# EasyEDA Pro project eda_uahyxtbgs-165w-three-way-multi-protocol-fa-dc91a91e.epro, board PCB_嘉立创8838*130mm铝机壳PCB尺寸13*8.4cm
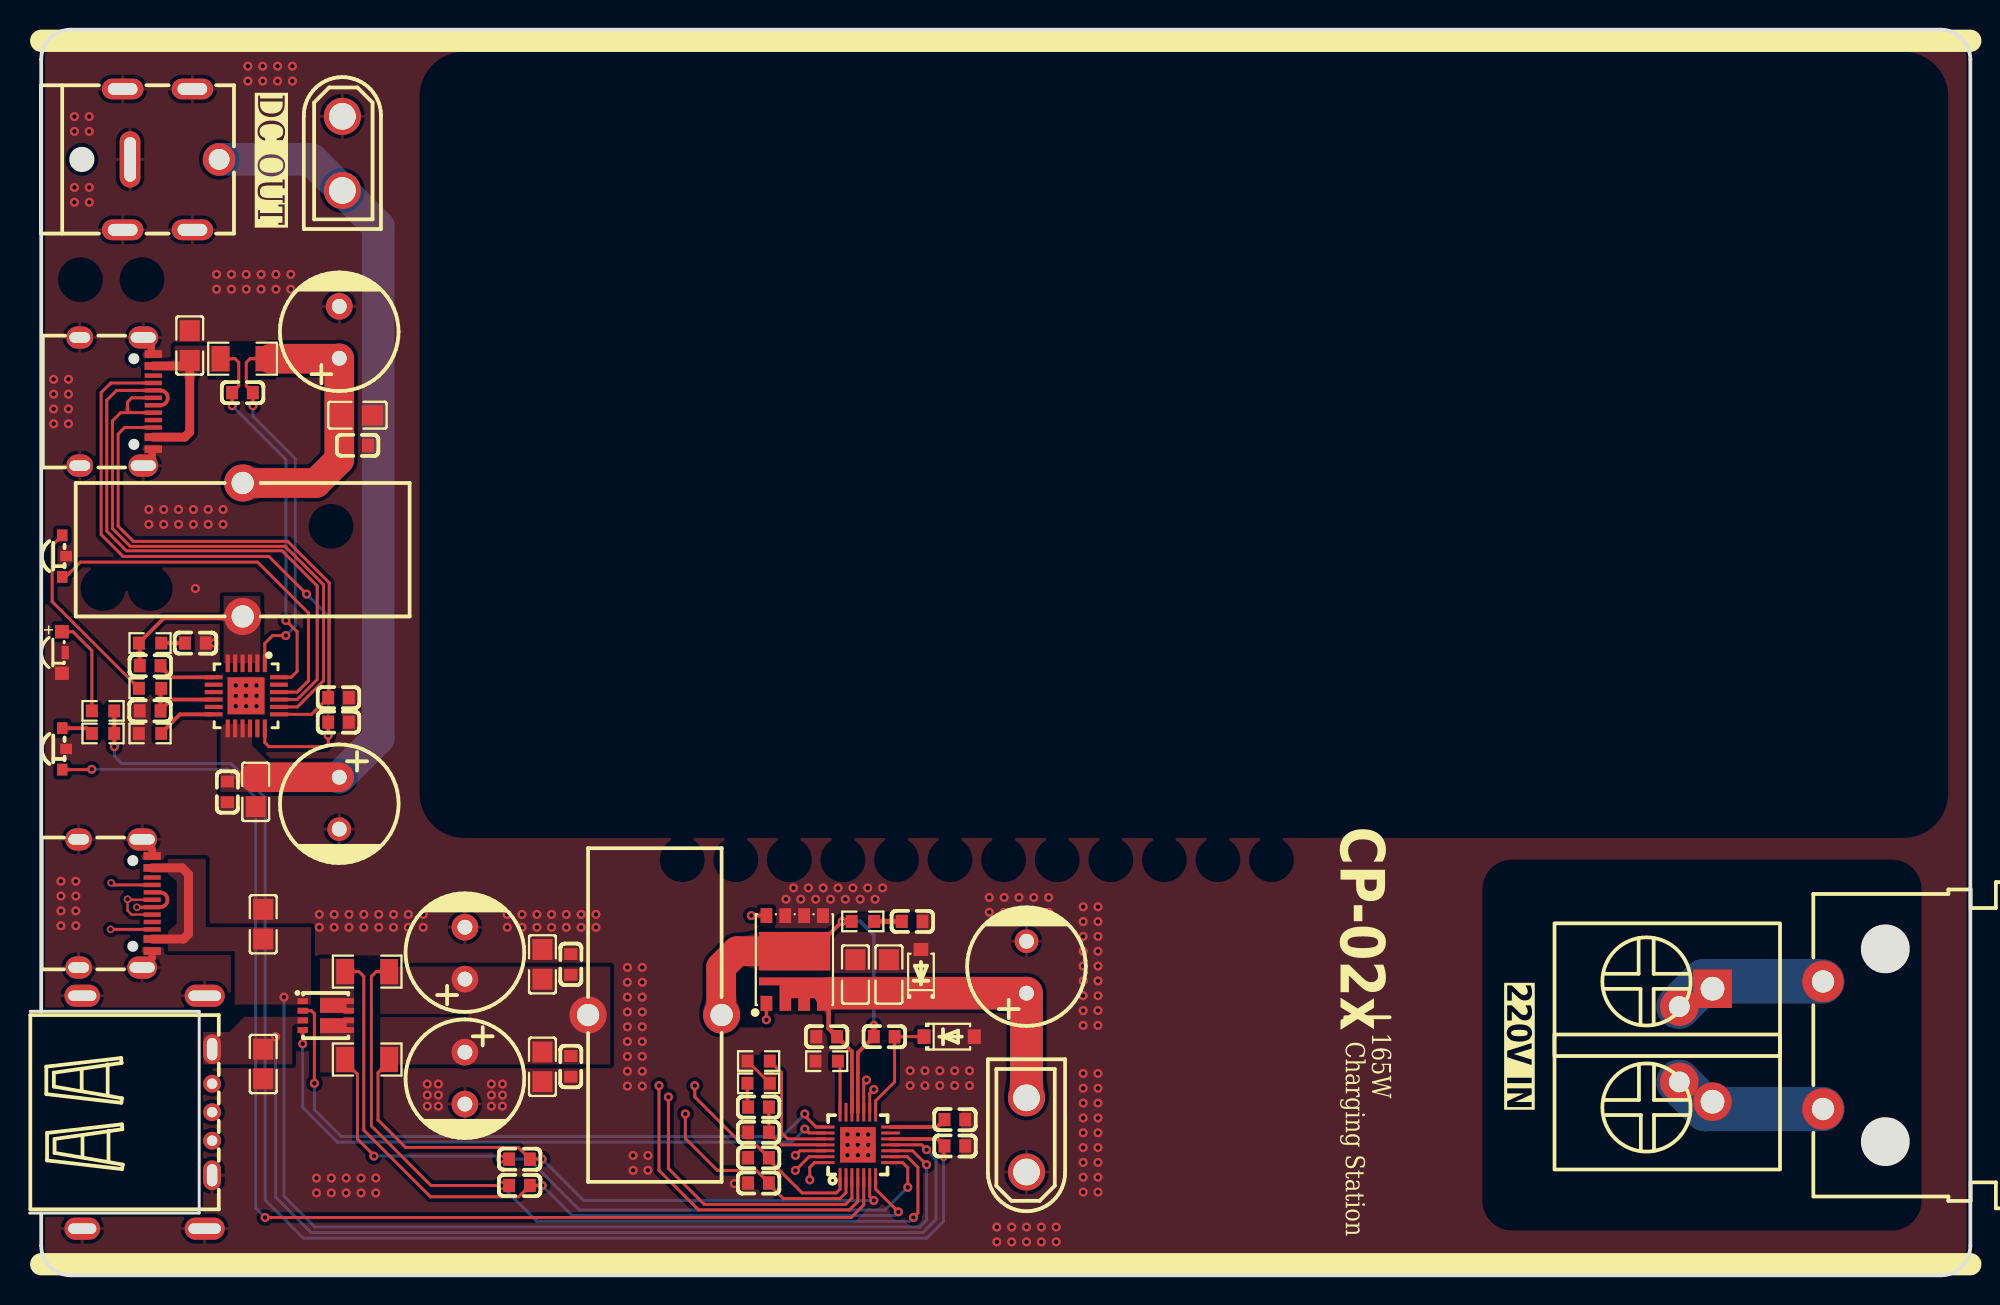
[diagram p8: board, top side]
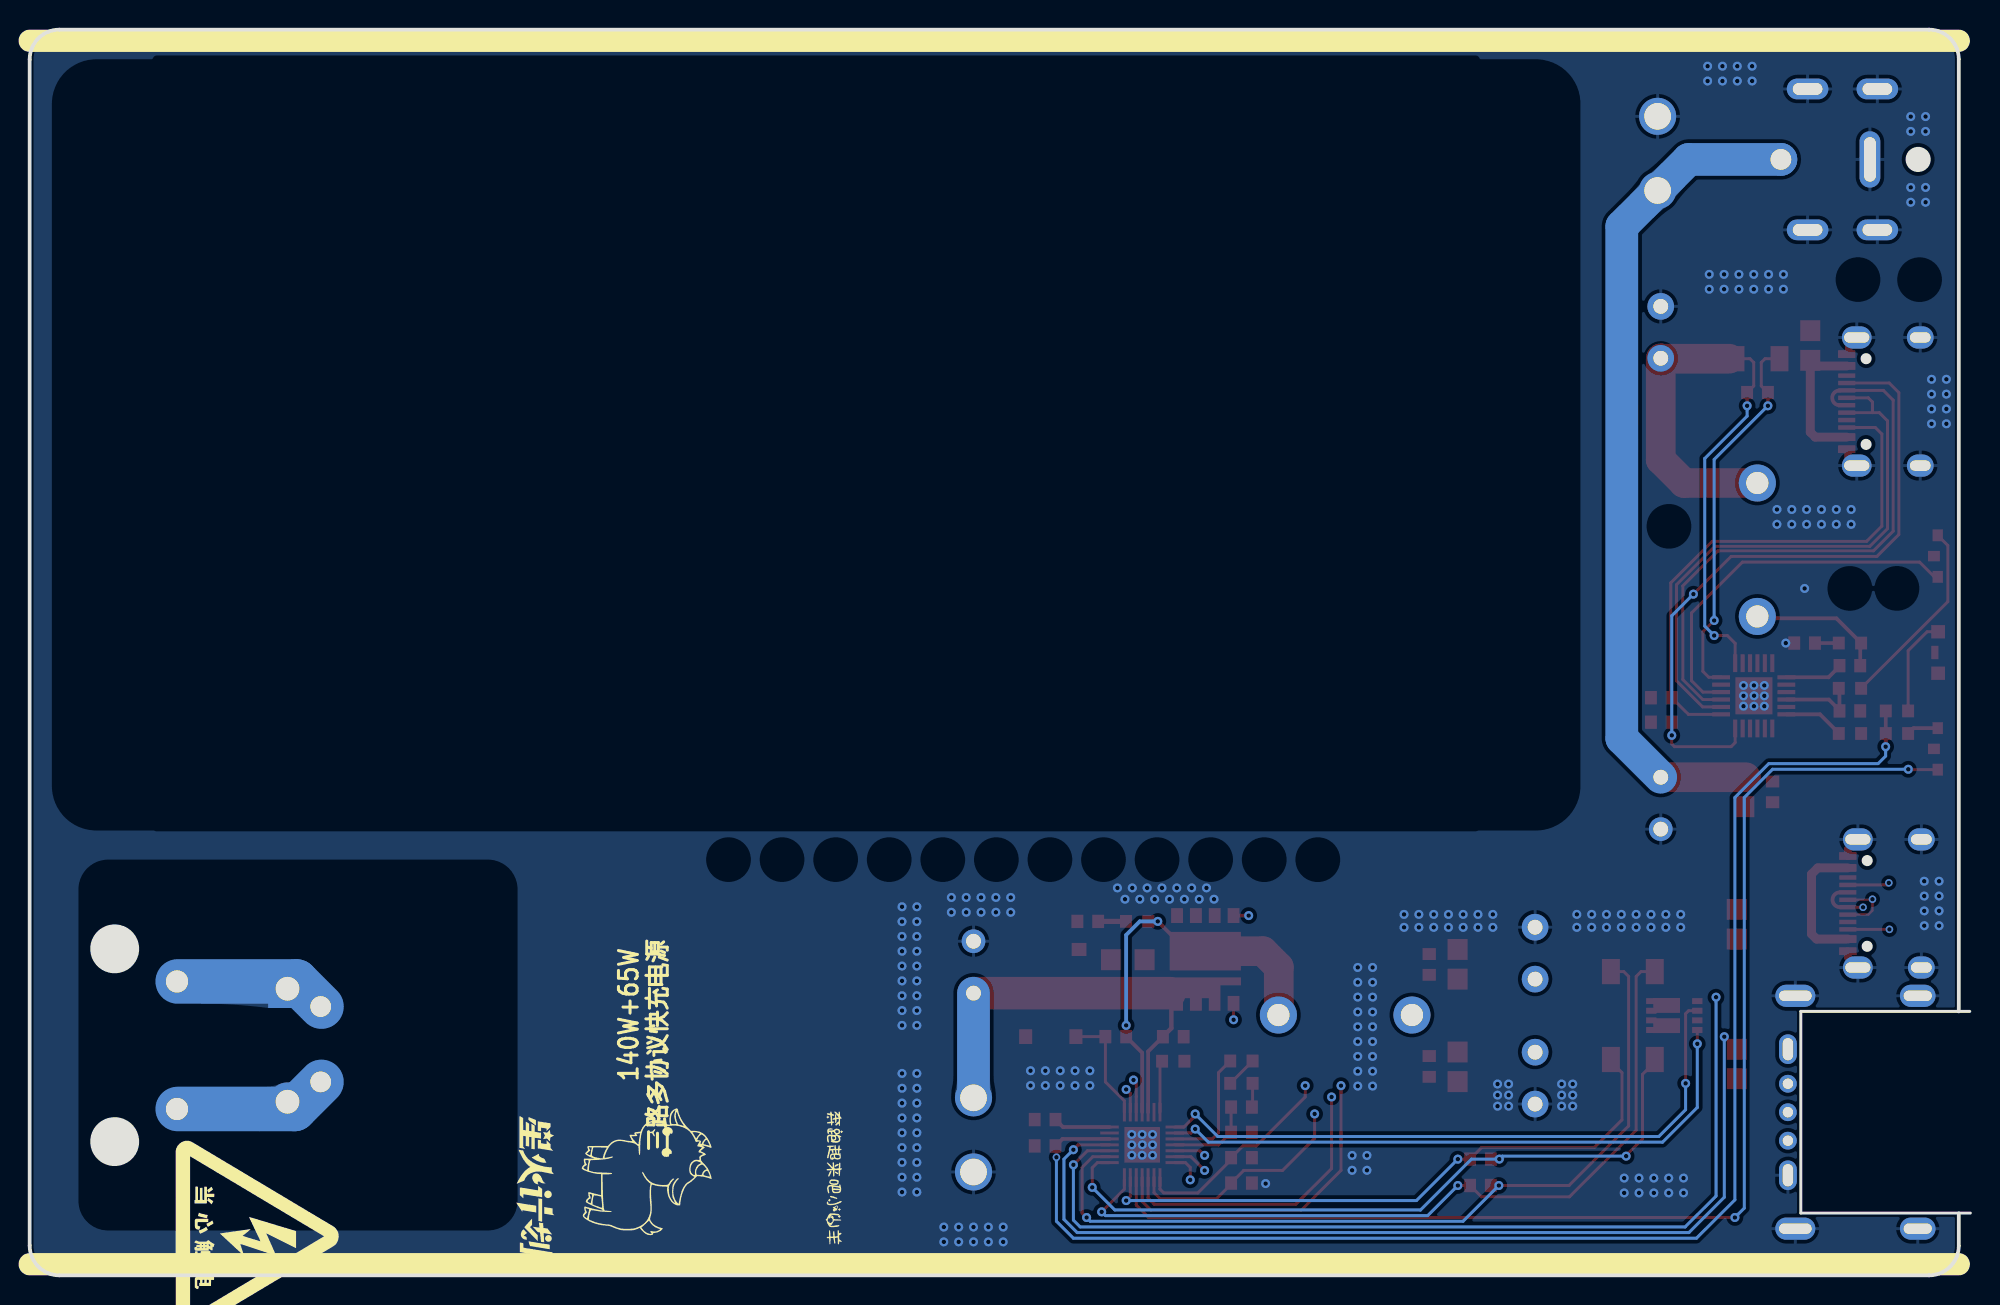
[diagram p9: board, bottom side, seen from below]

Outline 130.78 x 84 mm; copper layers: Top Layer, Inner1, Inner2, Bottom Layer. Coordinates in mm from the lower left corner of the outline.
Outline path: 0.78,17.8 0.78,82 arc(1.36,83.41) 2.78,84 128.78,84 arc(130.19,83.41) 130.78,82 130.78,2 arc(130.19,0.59) 128.78,0 2.78,0 arc(1.36,0.59) 0.78,2 0.78,4.18
Stack: Top Layer 0.035mm 外层铜厚1oz / Dielectric1 0.2104mm 7628 RC49% 8.6mil / Inner1 0.0152mm 内层铜厚 / Dielectric2 1.065mm 1.1mm H/HOZ Copper / Inner2 0.0152mm 内层铜厚 / Dielectric3 0.2104mm 7628 RC49% 8.6mil / Bottom Layer 0.035mm 外层铜厚1oz

## Design rules (mm)
spacing copperThickness1oz: track to track 0.102, other pairs 0.152 to 0.3
spacing copperThickness2oz (default): track to track 0.102, other pairs 0.152 to 0.3
spacing Plane_innerPlane: track to track 0.102, other pairs 0.152 to 0.3
spacing Copper_copperRegion: track to track 0.102, other pairs 0.152 to 0.3
track width copperThickness1oz (default): min 0.127, default 0.254, max 6
track width copperThickness2oz: min 0.203, default 0.254, max 2.54
differential pair differentialPair (default): width min 0.127, default 0.254, max 2.54; gap min 0.152, default 0.152
region e1 uses Copper_copperRegion
region e2 uses Copper_copperRegion
region e3 uses Copper_copperRegion
region e4 uses Copper_copperRegion
region e5 uses Copper_copperRegion
region e6 uses Copper_copperRegion
region e7 uses Copper_copperRegion
region e8 uses Copper_copperRegion
region e9 uses Copper_copperRegion
region e10 uses Copper_copperRegion
region e11 uses Copper_copperRegion
region e12 uses Copper_copperRegion
region e13 uses Copper_copperRegion
region e14 uses Copper_copperRegion
region e15 uses Copper_copperRegion
region e16 uses Copper_copperRegion
region e17 uses Copper_copperRegion
region e18 uses Copper_copperRegion
region e19 uses Copper_copperRegion
region e20 uses Copper_copperRegion
region e21 uses Copper_copperRegion
region e22 uses Copper_copperRegion
region e23 uses Copper_copperRegion
region e24 uses Copper_copperRegion
region e25 uses Copper_copperRegion
region e26 uses Copper_copperRegion
region e27 uses Copper_copperRegion
region e28 uses Copper_copperRegion
region e29 uses Copper_copperRegion
region e30 uses Copper_copperRegion
region e31 uses Copper_copperRegion
region e32 uses Copper_copperRegion
region e33 uses Copper_copperRegion
region e34 uses Copper_copperRegion
region e35 uses Copper_copperRegion
region e36 uses Copper_copperRegion
region e37 uses Copper_copperRegion
region e38 uses Copper_copperRegion
region e39 uses Copper_copperRegion
region e40 uses Copper_copperRegion
region e41 uses Copper_copperRegion
region e42 uses Copper_copperRegion
region e43 uses Copper_copperRegion
region e44 uses Copper_copperRegion
region e45 uses Copper_copperRegion
region e46 uses Copper_copperRegion
region e47 uses Copper_copperRegion
region e48 uses Copper_copperRegion
region e49 uses Copper_copperRegion
region e50 uses Copper_copperRegion
region e51 uses Copper_copperRegion
region e52 uses Copper_copperRegion
region e53 uses Copper_copperRegion
region e54 uses Copper_copperRegion
region e55 uses Copper_copperRegion
region e56 uses Copper_copperRegion
region e57 uses Copper_copperRegion
region e58 uses Copper_copperRegion
region e59 uses Copper_copperRegion
region e60 uses Copper_copperRegion
region e61 uses Copper_copperRegion
region e62 uses Copper_copperRegion
region e63 uses Copper_copperRegion
region e64 uses Copper_copperRegion
region e65 uses Copper_copperRegion
region e66 uses Copper_copperRegion
region e67 uses Copper_copperRegion
region e68 uses Copper_copperRegion
region e69 uses Copper_copperRegion
region e70 uses Copper_copperRegion
region e71 uses Copper_copperRegion
region e72 uses Copper_copperRegion
region e73 uses Copper_copperRegion
region e74 uses Copper_copperRegion
region e75 uses Copper_copperRegion
region e76 uses Copper_copperRegion
region e77 uses Copper_copperRegion
region e78 uses Copper_copperRegion
region e79 uses Copper_copperRegion
region e80 uses Copper_copperRegion
region e81 uses Copper_copperRegion
region e82 uses Copper_copperRegion
region e83 uses Copper_copperRegion
region e84 uses Copper_copperRegion
region e85 uses Copper_copperRegion
region e86 uses Copper_copperRegion
region e87 uses Copper_copperRegion
region e88 uses Copper_copperRegion
region e89 uses Copper_copperRegion
region e90 uses Copper_copperRegion
region e91 uses Copper_copperRegion
region e92 uses Copper_copperRegion
region e93 uses Copper_copperRegion
pour e841 uses Copper_copperRegion
pour e930 uses Copper_copperRegion
pour e1018 uses Copper_copperRegion

## Placement (name value [footprint] x y rotation side)
C1  100pF  [C0603]  49.11 9.64 180 top
C2  2.2nF  [C0603_1]  49.11 11.35 180 top
C3  100nF  [C0603_1]  53.71 16.09 0 top
C4  22uF  [C0805]  57.9 20.28 270 top
C5  330pF  [C0603]  49.11 7.93 180 top
C6  22uF  [C0805]  15.23 32.6 90 top
C7  330pF  [C0603]  49.11 6.23 180 top
C8  100nF  [C0603_1]  57.59 16.1 180 top
C9  100nF  [C0603_1]  36.46 20.97 270 top
C10  22uF  [C0805]  34.55 20.97 270 top
C11  10uF  [C0805]  15.74 14.25 90 top
C12  1uF  [C0603]  62.35 8.73 180 top
C13  1uF  [C0603]  62.35 10.5 180 top
C14  10uF  [C0805]  15.74 23.68 270 top
C15  100nF  [C0603_1]  33.01 7.84 180 top
C16  100nF  [C0603_1]  33.01 6.06 180 top
C17  330pF  [C0603]  20.82 38.95 0 top
C18  330pF  [C0603]  20.82 37.3 0 top
C19  100nF  [C0603_1]  13.33 32.6 90 top
C20  100nF  [C0603_1]  8.12 41.11 180 top
C21  1uF  [C0603]  8.12 38.06 0 top
C22  2.2nF  [C0603_1]  11.17 42.64 180 top
C23  100nF  [C0603_1]  22.09 55.97 180 top
C24  22uF  [C0805]  22.09 58 180 top
C25  100nF  [C0603_1]  14.34 59.53 180 top
C26  10uF  [C0805]  10.79 62.7 270 top
C32  2.2nF  [C0603_1]  59.47 23.87 180 top
C33  22uF  [C0805]  34.55 14.06 90 top
C34  100nF  [C0603_1]  36.46 14.09 90 top
C35  22uF  [C0805]  55.65 20.28 270 top
CN2  RT-C08-F2-BH  [AC-IN-TH_RT-C08-F2-WH]  120.85 15.52 90 top
CN3  XT30UPB-M  [CONN-TH_XT30UPB-M]  21.07 75.66 270 top
EC1  220uF  [CAP-TH_BD8.0-P3.50-D0.6-FD-2]  67.17 20.78 90 top
EC2  100uF  [CAP-TH_BD8.0-P3.50-D0.6-FD]  29.33 21.72 90 top
EC3  100uF  [CAP-TH_BD8.0-P3.50-D0.6-FD]  29.33 13.3 270 top
EC4  220uF  [CAP-TH_BD8.0-P3.50-D0.6-FD-2]  20.86 31.84 270 top
EC5  220uF  [CAP-TH_BD8.0-P3.50-D0.6-FD-2#2]  20.86 63.59 90 top
J1  U263-163N-4OS1735  [USB-C-SMD_U263-163N-4GS1735]  5.78 25.08 270 top
J2  U224-051N-3GRA035  [USB-A-TH_U224-051N-3GRA035]  7.84 11 270 top
J3  U263-163N-4OS1735  [USB-C-SMD_U263-163N-4GS1735]  5.85 58.92 270 top
L1  22uH  [IND-TH_L20-W10-P9.00-D1.2]  42.13 17.55 90 top
L3  22uH  [IND-TH_L20-W10-P9.00-D1.2]  14.35 48.93 0 top
LED1  XL-3210UGC  [LED-SMD_3P-L3.2-W1.5-RD_GREEN]  2.28 42 90 top
LED2  XL-3210UOC  [LED-SMD_3P-L3.2-W1.5-RD_ORANGE]  2.32 35.5 90 top
LED3  XL-3210UOC  [LED-SMD_3P-L3.2-W1.5-RD_ORANGE]  2.32 48.5 90 top
NOREF  -  [Pad_e370]  111.17 13.04 270 top
NOREF#2  -  [Pad_e369]  111.17 18.12 270 top
Q1  RUH30J51M  [DFN-8_L6.0-W5.0-P1.27_AON6938]  51.55 21.3 0 top
Q4  ESN4838  [DFN-8_L3.0-W3.0-P0.65-LS3.4-BL]  19.95 17.52 270 top
R1  20kΩ  [R0603]  49.12 12.95 180 top
R2  SDNT1608X103F3380FTF  [R0603_1]  49.12 14.45 0 top
R3  5.1kΩ  [R0603_1]  4.94 38.06 0 top
R4  100kΩ  [R0603_1]  53.71 14.44 0 top
R5  5.1kΩ  [R0603_1]  8.11 39.59 0 top
R7  33kΩ  [R0603]  8.11 36.54 0 top
R8  2Ω  [R0603_1]  8.11 42.64 180 top
R9  5mΩ  [R1206]  22.74 20.48 180 top
R10  5.1kΩ  [R0603_1]  4.94 36.54 180 top
R11  5mΩ  [R1206]  22.74 14.55 180 top
R12  10mΩ  [R1206]  14.34 61.81 180 top
R20  2Ω  [R0603_1]  56.14 23.87 180 top
T1  SMF30A  [SOD-123_L2.6-W1.6-LS3.5-RD]  61.97 16.09 0 top
T2  SMF30A  [SOD-123_L2.6-W1.6-LS3.5-RD]  60.06 20.28 90 top
U1  SW3526  [QFN-24_L4.0-W4.0-P0.50-TL-EP2.5]  14.6 39.08 270 top
U2  SW3538  [QFN-28_L4.0-W4.0-P0.40-TL-EP2.4]  55.81 8.8 90 top
U3  DBT50G-7.62-2P-BK-P  [CONN-TH_2P-P7.62_L15.2-W16.7-EX4.2]  113.4 15.52 270 top
U4  XT30UPB-M  [CONN-TH_XT30UPB-M]  67.17 9.47 90 top
U5  HX DC007B-2.0-J  [DC-IN-TH_HX-DC007B-2.5]  9.52 75.25 0 top

## Footprints (pads in the part's own frame, mm; a bottom-side part is the same pattern mirrored in y, then rotated)
AC-IN-TH_RT-C08-F2-WH
  round 2.8 hole 1.5: 1(4.3,0) 2(-4.3,0)
C0603
  rect 0.8x0.9 smd: 1(-0.7,0) 2(0.7,0)
C0603_1
  rect 0.8x0.9 smd: 1(-0.7,0) 2(0.7,0)
C0805
  rect 1.41x1.35 smd: 1(-1,0) 2(1,0)
CAP-TH_BD8.0-P3.50-D0.6-FD
  round 1.8 hole 1: 1(-1.75,0) 2(1.75,0)
CAP-TH_BD8.0-P3.50-D0.6-FD-2
  round 1.6 hole 1: 1(-1.75,0) 2(1.75,0)
CAP-TH_BD8.0-P3.50-D0.6-FD-2#2
  round 1.8 hole 1: 1(-1.75,0) 2(1.75,0)
CONN-TH_2P-P7.62_L15.2-W16.7-EX4.2
  rect 2.6x2.6 hole 1.6: 1(-3.81,0)
  round 2.6 hole 1.6: 2(3.81,0)
CONN-TH_XT30UPB-M
  round 2.5 hole 1.8: 1(-2.5,0) 2(2.5,0)
DC-IN-TH_HX-DC007B-2.5
  round 2.2 hole 1.4: 1(3.25,0)
  oval 1.4x3.8 hole 0.8x3: 2(-2.75,0)
  oval 2.8x1.4 hole 2x0.8: 3(-3.25,4.75) 3(-3.25,-4.75) 3(1.45,4.75) 3(1.45,-4.75)
DFN-8_L3.0-W3.0-P0.65-LS3.4-BL
  rect 0.4x0.7 smd: 1(-0.975,-1.55) 2(-0.325,-1.55) 3(0.325,-1.55) 4(0.975,-1.55) 5(0.975,1.55) 6(0.325,1.55) 7(-0.325,1.55) 8(-0.975,1.55)
  rect 1x1.8 smd: 6(0.68,0.515) 8(-0.68,0.515)
DFN-8_L6.0-W5.0-P1.27_AON6938
  rect 0.8x1 smd: 1(-1.905,-2.96) 3(1.905,2.96) 4(0.635,2.96) 5(-0.635,2.96) 6(-1.905,2.96)
  custom 4.8x2.25 smd: 2(-0.005,-1.91)
  rect 4.8x2.6 smd: 7(0,0.56)
IND-TH_L20-W10-P9.00-D1.2
  round 2.5 hole 1.5: 1(0,-4.5) 2(0,4.5)
LED-SMD_3P-L3.2-W1.5-RD_GREEN
  rect 0.9x0.93 smd: 1(-1.4,0.11) 2(1.4,0.11)
  rect 0.9x0.49 smd: 3(0,-0.11)
LED-SMD_3P-L3.2-W1.5-RD_ORANGE
  rect 0.8x0.7 smd: 1(-1.4,0.127) 2(1.4,0.127)
  rect 0.7x0.8 smd: 3(0,-0.127)
Pad_e369
  round 2.6 hole 1.4: 1(0,0)
Pad_e370
  round 2.6 hole 1.4: 1(0,0)
QFN-24_L4.0-W4.0-P0.50-TL-EP2.5
  rect 1.2x0.28 smd: 1(-2.2,1.25) 2(-2.2,0.75) 3(-2.2,0.25) 4(-2.2,-0.25) 5(-2.2,-0.75) 6(-2.2,-1.25) 13(2.2,-1.25) 14(2.2,-0.75) 15(2.2,-0.25) 16(2.2,0.25) 17(2.2,0.75) 18(2.2,1.25)
  rect 0.28x1.2 smd: 7(-1.25,-2.2) 8(-0.75,-2.2) 9(-0.25,-2.2) 10(0.25,-2.2) 11(0.75,-2.2) 12(1.25,-2.2) 19(1.25,2.2) 20(0.75,2.2) 21(0.25,2.2) 22(-0.25,2.2) 23(-0.75,2.2) 24(-1.25,2.2)
  rect 2.5x2.5 smd: 25(-0.001,-0.013)
QFN-28_L4.0-W4.0-P0.40-TL-EP2.4
  rect 1.25x0.2 smd: 1(-2.2,1.2) 2(-2.2,0.8) 3(-2.2,0.4) 4(-2.2,0.001) 5(-2.2,-0.4) 6(-2.2,-0.8) 7(-2.2,-1.2) 15(2.2,-1.2) 16(2.2,-0.8) 17(2.2,-0.4) 18(2.2,0) 19(2.2,0.4) 20(2.2,0.8) 21(2.2,1.2)
  rect 0.2x1.25 smd: 8(-1.2,-2.2) 9(-0.8,-2.2) 10(-0.4,-2.2) 11(0,-2.2) 12(0.4,-2.2) 13(0.8,-2.2) 14(1.2,-2.2) 22(1.2,2.2) 23(0.8,2.2) 24(0.4,2.2) 25(0,2.2) 26(-0.4,2.2) 27(-0.8,2.2) 28(-1.2,2.2)
  rect 2.4x2.4 smd: 29(0,-0.001)
R0603
  rect 0.806x0.864 smd: 1(-0.753,0) 2(0.753,0)
R0603_1
  rect 0.806x0.864 smd: 1(-0.753,0) 2(0.753,0)
R1206
  rect 1.208x1.701 smd: 1(-1.479,0) 2(1.479,0)
SOD-123_L2.6-W1.6-LS3.5-RD
  rect 0.88x0.99 smd: 1(-1.692,0) 2(1.692,0)
USB-A-TH_U224-051N-3GRA035
  oval 2x1.2 hole 1.5x0.7: 1(-4.25,4.45) 5(4.25,4.45)
  round 1.2 hole 0.7: 2(-1.92,4.45) 3(0,4.45) 4(1.92,4.45)
  oval 1.5x2.7 hole 0.7x2.2: 6(-7.85,3.95) 7(7.85,3.95)
  oval 1.5x2.4 hole 0.7x1.9: 8(-7.85,-4.3) 9(7.85,-4.3)
USB-C-SMD_U263-163N-4GS1735
  rect 0.5x1.15 smd: A1(-3.2,2.478) A4(-2.4,2.478) A9(2.4,2.478) A12(3.219,2.478) B1(3.219,2.478) B4(2.4,2.478) B9(-2.4,2.478) B12(-3.2,2.478)
  rect 0.3x1.15 smd: A5(-1.25,2.478) A6(-0.25,2.478) A7(0.25,2.478) A8(1.25,2.478) B5(1.75,2.478) B6(0.75,2.478) B7(-0.75,2.478) B8(-1.75,2.478)
  oval 1.5x2 hole 0.7x1.7: SH1(-4.32,1.802) SH1(4.32,1.802)
  oval 1.5x1.8 hole 0.7x1.4: SH1(-4.32,-2.478) SH1(4.32,-2.478)

## Nets
As in the schematic, except:
$CN2_1: CN2.1 NOREF#2.1 U3.1
$CN2_2: CN2.2 NOREF.1 U3.2

Pads without a net: J1 A8 B8; J3 A8 B8; U1 8 9 11 17 23; U2 13 20

## Via types
v1: diameter 0.61, hole 0.305, Top Layer to Bottom Layer, 270 vias
v2: diameter 0.508, hole 0.305, Top Layer to Bottom Layer, 5 vias

## Routing (per net, layer and track width the routed paths; a pad name or vN(x,y) marks a point on that pad's centre or on a via; arc(x,y) is an arc through that point)
GND: length 7.3
  Top Layer w0.2: R2.1 49.87,12.95 R1.1
  Top Layer w0.5: 8.19,62.12 8.19,63.24 ; 8.25,55.7 8.25,54.48 ; J1.A1 8.25,28.72 J1.SH1 ; J1.A12 8.25,21.43 J1.SH1
  vias: v1(1.61,60.42) v1(1.61,59.42) v1(1.61,58.42) v1(1.61,57.42) v1(2.11,26.58) v1(2.11,25.58) v1(2.11,24.58) v1(2.11,23.58) v1(2.61,60.42) v1(2.61,59.42) v1(2.61,58.42) v1(2.61,57.42) v1(3.02,78.14) v1(3.02,77.14) v1(3.02,73.36) v1(3.02,72.36) v1(3.11,26.58) v1(3.11,25.58) v1(3.11,24.58) v1(3.11,23.58) v1(4.02,78.14) v1(4.02,77.14) v1(4.02,73.36) v1(4.02,72.36) v1(8.03,51.64) v1(8.03,50.64) v1(9.03,51.64) v1(9.03,50.64) v1(10.03,51.64) v1(10.03,50.64) v1(11.03,51.64) v1(11.03,50.64) v1(11.17,46.32) v1(12.03,51.64) v1(12.03,50.64) v1(12.44,42.64) v1(12.59,67.5) v1(12.59,66.5) v1(13.03,51.64) v1(13.03,50.64) v1(13.59,67.5) v1(13.59,66.5) v1(13.88,39.78) v1(13.88,39.08) v1(13.88,38.38) v1(14.59,67.5) v1(14.59,66.5) v1(14.58,39.78) v1(14.57,39.09) v1(14.58,38.38) v1(14.7,81.54) v1(14.7,80.54) v1(15.28,39.78) v1(15.28,39.08) v1(15.28,38.38) v1(15.59,67.5) v1(15.59,66.5) v1(15.7,81.54) v1(15.7,80.54) v1(16.59,67.5) v1(16.59,66.5) v1(16.7,81.54) v1(16.7,80.54) v1(17.59,67.5) v1(17.59,66.5) v1(17.7,81.54) v1(17.7,80.54) v1(19.33,6.56) v1(19.33,5.56) v1(19.52,24.34) v1(19.52,23.47) v1(20.33,6.56) v1(20.33,5.56) v1(20.52,24.34) v1(20.52,23.47) v1(21.33,6.56) v1(21.33,5.56) v1(21.52,24.34) v1(21.52,23.47) v1(22.33,6.56) v1(22.33,5.56) v1(22.52,24.34) v1(22.52,23.47) v1(23.33,6.56) v1(23.33,5.56) v1(23.52,24.34) v1(23.52,23.47) v1(24.52,24.34) v1(24.52,23.47) v1(25.52,24.34) v1(25.52,23.47) v1(26.52,24.34) v1(26.52,23.47) v1(26.8,12.9) v1(26.8,12.16) v1(26.8,11.41) v1(27.54,12.9) v1(27.54,12.16) v1(27.54,11.41) v1(31.11,12.9) v1(31.11,12.16) v1(31.11,11.41) v1(31.86,12.9) v1(31.86,12.16) v1(31.86,11.41) v1(32.18,24.34) v1(32.18,23.47) v1(33.18,24.34) v1(33.18,23.47) v1(34.18,24.34) v1(34.18,23.47) v1(35.17,24.34) v1(35.17,23.47) v1(36.16,24.34) v1(36.16,23.47) v1(37.16,24.34) v1(37.16,23.47) v1(38.16,24.34) v1(38.16,23.47) v1(40.28,20.76) v1(40.28,19.76) v1(40.28,18.76) v1(40.28,17.76) v1(40.28,16.76) v1(40.28,15.76) v1(40.28,14.76) v1(40.28,13.76) v1(40.28,12.76) v1(40.66,8.08) v1(40.66,7.08) v1(41.28,20.76) v1(41.28,19.76) v1(41.28,18.76) v1(41.28,17.76) v1(41.28,16.76) v1(41.28,15.76) v1(41.28,14.76) v1(41.28,13.76) v1(41.28,12.76) v1(41.66,8.08) v1(41.66,7.08) v1(47.49,6.19) v1(50.97,25.36) v1(51.47,26.12) v1(51.97,25.36) v1(52.47,26.12) v1(52.97,25.36) v1(53.47,26.12) v1(53.97,25.36) v1(54.47,26.12) v1(54.97,25.36) v1(55.11,9.5) v1(55.11,8.8) v1(55.11,8.1) v1(55.47,26.12) v1(55.81,9.5) v1(55.8,8.81) v1(55.81,8.1) v1(55.97,25.36) v1(56.47,26.12) v1(56.51,9.5) v1(56.51,8.8) v1(56.51,8.1) v1(56.97,25.36) v1(57.47,26.12) v1(59.33,13.8) v1(59.33,12.8) v1(60.33,13.8) v1(60.33,12.8) v1(61.33,13.8) v1(61.33,12.8) v1(62.33,13.8) v1(62.33,12.8) v1(63.33,13.8) v1(63.33,12.8) v1(64.67,25.48) v1(64.67,24.48) v1(65.17,3.26) v1(65.17,2.26) v1(65.67,25.48) v1(65.67,24.48) v1(66.17,3.26) v1(66.17,2.26) v1(66.67,25.48) v1(66.67,24.48) v1(67.17,3.26) v1(67.17,2.26) v1(67.67,25.48) v1(67.67,24.48) v1(68.17,3.26) v1(68.17,2.26) v1(68.67,25.48) v1(68.67,24.48) v1(69.17,3.26) v1(69.17,2.26) v1(70.99,24.86) v1(70.99,23.85) v1(70.99,22.85) v1(70.99,21.85) v1(70.99,20.85) v1(70.99,19.85) v1(70.99,18.85) v1(70.99,17.85) v1(70.99,16.85) v1(70.99,13.62) v1(70.99,12.62) v1(70.99,11.62) v1(70.99,10.62) v1(70.99,9.62) v1(70.99,8.62) v1(70.99,7.62) v1(70.99,6.62) v1(70.99,5.62) v1(71.99,24.86) v1(71.99,23.85) v1(71.99,22.85) v1(71.99,21.85) v1(71.99,20.85) v1(71.99,19.85) v1(71.99,18.85) v1(71.99,17.85) v1(71.99,16.85) v1(71.99,13.62) v1(71.99,12.62) v1(71.99,11.62) v1(71.99,10.62) v1(71.99,9.62) v1(71.99,8.62) v1(71.99,7.62) v1(71.99,6.62) v1(71.99,5.62)
VBUSA1: length 64.2
  Top Layer w0.2: U2.11 60.11,8.8 v1(60.44,8.47)
  Bottom Layer w0.2: v1(16.58,16.09) 16.58,5.27 18.96,2.88 60.19,2.88 61.08,3.78 61.08,7.84 v1(60.44,8.47)
VBUSC1: length 73.6
  Top Layer w0.2: U2.10 59.5,8.4 v1(60.44,7.46)
  Top Layer w0.6: J1.A9 10.36,22.68 10.7,23.02 10.7,27.05 10.28,27.48 J1.A4
  Bottom Layer w0.2: 17.14,18.76 17.14,5.34 19.22,3.26 59.98,3.26 60.44,3.72 v1(60.44,7.46)
  vias: v1(17.14,18.76)
VDD1: length 97.7
  Top Layer w0.254: v1(5.71,35.65) 5.7,35.66 R10.1 R3.2 ; v2(61.59,7.96) 61.59,8.66 C12.2 61.17,9.2 U2.12
  Bottom Layer w0.2: v2(61.59,7.96) 61.59,3.65 60.44,2.5 18.45,2.5 15.87,5.09 15.87,32.22 13.58,34.51 6.21,34.51 5.71,35.02 v1(5.71,35.65)
VIN: length 35.1
  Top Layer w0.254: C3.2 55.41,15.09 U2.19
  Top Layer w0.3: 53.84,18.12 53.84,16.66 C3.2
  Top Layer w2.2: 53.97,19.03 EC1.1 67.17,11.97
  Bottom Layer w2.2: EC1.1 67.17,11.97
VIN2: length 56.6
  Top Layer w2: EC4.1 15.13,33.59
  Bottom Layer w2.2: EC4.1 23.49,36.21 23.49,70.74 CN3.2 18.98,75.25 U5.1
$C2_2: length 1.6
  Top Layer w0.2: C2.2 48.37,11.39 R1.2
$C13_2: length 3.8
  Top Layer w0.254: U2.14 61.14,10 C13.2
$C20_1: length 3.9
  Top Layer w0.254: C20.1 8.82,41.06 9.55,40.33 U1.7
$C22_2: length 1.6
  Top Layer w0.254: R8.1 C22.2
$C32_2: length 1.9
  Top Layer w0.35: C32.2 R20.1
$CN2_1: length 10.4
  Bottom Layer w3: 111.12,18.12 112.81,19.82 120.8,19.82
$CN2_2: length 10.4
  Bottom Layer w3: 111.12,13.04 112.94,11.22 120.8,11.22
$LED1_2: length 6.6
  Top Layer w0.2: LED1.2 2.91,43.4 4.19,42.12 R3.1
$LED2_2: length 2.1
  Top Layer w0.254: LED2.2 3.83,36.9 R10.2
$LED3_2: length 13
  Top Layer w0.2: LED3.2 1.52,49.22 1.52,45.43 R5.1
$R7_2: length 4.1
  Top Layer w0.254: R7.2 8.86,36.57 10.13,37.83 U1.12
BST1: length 7.6
  Top Layer w0.2: T1.1 60.27,16.1 58.28,16.1 58.28,13.04 57.01,11.77 U2.15
CC1: length 45.9
  Top Layer w0.2: 15.85,36.88 15.85,35.92 16.12,35.65 19.93,35.65 20.12,35.84 v1(20.12,36.41) ; v1(18.66,45.94) 16.12,48.48 6.3,48.48 4.82,49.96 4.82,59.53 5.46,60.17 J3.A5 ; v1(20.12,36.41) C18.1 ; v1(20.12,36.41) 20.18,36.41
  Bottom Layer w0.2: v1(20.12,36.41) 20.12,44.48 v1(18.66,45.94)
CC1_1: length 70.5
  Top Layer w0.2: C7.1 49.81,6.15 50.79,5.17 54.6,5.17 55.01,5.58 U2.2 ; v2(5.49,26.47) 5.63,26.33 J1.A5
  Top Layer w0.203: C7.1 48.96,7.07 46.35,7.07 44.19,9.23 v1(44.19,10.88)
  Inner2 w0.2: v1(44.19,10.88) 44.19,23.08 40.8,26.47 v2(5.49,26.47)
CC2: length 36.1
  Top Layer w0.2: U1.19 19,37.83 C17.1 20.18,39.02 20.18,46.7 17.39,49.49 6.99,49.49 5.96,50.53 5.96,56.73 6.4,57.17 J3.B5
CC2_1: length 73
  Top Layer w0.2: J1.B5 8.25,23.33 v2(5.45,23.33) ; U2.1 54.61,5.81 54.36,5.56 52.05,5.56 49.81,7.8 C5.1 ; v1(44.82,12.79) 44.82,12.03 48.12,8.73 49.02,8.73 C5.1 ; C5.1 49.81,7.98
  Inner2 w0.2: v2(5.45,23.33) 4.63,24.15 4.63,26.7 4.94,27.01 40.89,27.01 44.82,23.08 v1(44.82,12.79)
COMP1: length 5.8
  Top Layer w0.2: C2.1 C1.1 50.66,8.8 U2.25
CSN: length 35.6
  Top Layer w0.2: R12.2 13.83,61.81 14.09,61.56 14.09,59.97 C25.2 v1(13.64,58.64) ; v1(17.26,44.16) 18.03,43.4 18.03,40.73 17.62,40.33 U1.24
  Top Layer w0.6: J3.A4 10.41,61.32 C26.2 10.79,56.86 10.45,56.52 J3.A9
  Bottom Layer w0.2: v1(13.64,58.64) 17.26,55.02 v1(17.26,44.16)
CSNA1: length 48.6
  Top Layer w0.2: 21.26,14.55 21.26,14.38 22.09,13.55 22.09,9.2 23.19,8.09 v1(23.19,8.04) ; U2.8 58.82,7.6 59.17,7.25 v1(59.17,5.93)
  Top Layer w0.254: v1(31.74,7.84) C15.2
  Bottom Layer w0.2: v1(59.17,5.93) 57.65,4.41 37.05,4.41 33.62,7.84 v1(31.74,7.84) 31.54,8.04 v1(23.19,8.04)
CSNC1: length 53.7
  Top Layer w0.2: v1(58.54,4.28) 57.01,5.81 57.01,6.44 ; v1(34.53,6.06) C16.1 32.95,5.3 27.01,5.3 22.52,9.79 22.52,20.16 22.19,20.48 R9.2
  Bottom Layer w0.2: v1(34.53,6.06) 36.57,4.03 58.28,4.03 v1(58.54,4.28)
CSP: length 42.9
  Top Layer w0.2: R12.1 14.85,61.81 14.6,61.56 14.6,59.97 C25.1 v1(15.04,58.64) ; v1(17.26,43.14) 16.37,43.14 15.85,42.61 U1.1
  Top Layer w2: 14.35,53.43 19.3,53.43 20.86,55 EC5.1 ; 20.83,61.81 16.25,61.81
  Bottom Layer w0.2: v1(17.26,43.14) 17.9,43.78 17.9,55.08 15.04,57.94 v1(15.04,58.64)
CSPA1: length 98.6
  Top Layer w0.2: v1(59.55,3.9) 59.86,4.2 59.86,7.28 59.14,8 U2.9 ; v1(56.89,5.04) 56.61,5.32 U2.6 ; v1(34.53,7.84) C15.1 32.92,8.63 25.33,8.63 23.47,10.48 23.47,13.67 24.22,14.41 R11.1 ; R9.1 23.35,20.48 23.03,20.16 23.03,10.07 27.04,6.06 v1(31.77,6.06) C16.2
  Bottom Layer w0.2: v1(34.53,7.84) 37.33,5.04 v1(56.89,5.04) ; v1(59.55,3.9) 59.3,3.65 34.19,3.65 v1(31.77,6.06)
DMA1: length 46
  Top Layer w0.2: v1(52.57,6.44) 52.57,7.28 52.89,7.6 U2.28
  Inner2 w0.2: v1(52.57,6.44) 52.57,8.22 51.05,9.74 15.47,9.74 J2.2
DMC: length 39
  Top Layer w0.2: U1.21 18.03,38.83 19.37,40.17 19.37,46.49 17.01,48.86 6.52,48.86 5.2,50.18 5.2,59.02 5.85,59.67 J3.B7
  Top Layer w0.254: 8.81,59.67 arc(9.31,59.17) 8.81,58.67
DMC_1: length 71
  Top Layer w0.203: J1.A7 8.25,24.82 v2(7.23,24.82) ; v1(42.41,12.79) 42.41,7.08 45.08,4.41 55.24,4.41 55.81,4.98 U2.4
  Top Layer w0.254: 8.79,25.83 arc(9.29,25.33) 8.79,24.83
  Inner2 w0.2: v1(42.41,12.79) 42.41,22.82 40.12,25.11 7.43,25.11 7.23,24.91 v2(7.23,24.82)
DPA1: length 42.5
  Top Layer w0.2: v1(51.6,7.07) 52.53,8 U2.27
  Inner2 w0.2: v1(51.6,7.07) 49.7,8.98 12.39,8.98 J2.4
DPC: length 38.8
  Top Layer w0.2: J3.A6 6.88,59.17 6.59,58.89 6.59,58.17 ; U1.20 18.04,38.33 19.8,40.09 19.8,46.57 17.22,49.16 6.77,49.16 5.58,50.35 5.58,57.62 6.13,58.17 J3.B6
DPC_1: length 72.4
  Top Layer w0.152: J1.B6 6.87,24.33 6.59,24.6 v2(6.59,25.36) ; J1.A6 6.63,25.33
  Top Layer w0.2: U2.3 55.41,5.22 54.98,4.79 45.46,4.79 43.04,7.2 v1(43.04,12.03)
  Top Layer w0.203: 6.63,25.33 v2(6.59,25.36)
  Inner2 w0.2: v2(6.59,25.36) 6.75,25.52 40.35,25.52 43.04,22.82 v1(43.04,12.03)
FLED: length 25.3
  Top Layer w0.2: LED3.1 2.42,47.1 3.42,48.1 15.36,48.1 18.79,44.67 18.79,40.09 18.02,39.33 U1.22
FLED_1: length 85
  Top Layer w0.2: v1(15.87,3.9) 55.36,3.9 56.21,4.75 U2.5
  Top Layer w0.203: LED2.1 4.16,34.1 v1(4.18,34.13)
  Bottom Layer w0.2: v1(4.18,34.13) 13.33,34.13 15.23,32.22 15.23,4.53 v1(15.87,3.9)
GATEA1: length 41.9
  Top Layer w0.2: v1(18.4,15.61) Q4.4 ; U2.23 52.51,9.6 v1(52.24,9.87)
  Bottom Layer w0.2: v1(52.24,9.87) 51.35,8.98 20.74,8.98 18.4,11.32 v1(18.4,15.61)
GATEC1: length 43.6
  Top Layer w0.2: Q4.2 18.99,17.84 19.19,17.65 v1(19.19,12.95) ; v1(52.24,10.88) 52.24,10.76 52.99,10 U2.22
  Bottom Layer w0.2: v1(52.24,10.88) 50.71,9.36 20.99,9.36 19.19,11.17 v1(19.19,12.95)
HGATE1: length 11.8
  Top Layer w0.2: v1(49.65,17.24) Q1.1 ; U2.17 56.21,12.04 56.2,12.05 56.2,13 56.38,13.17 v1(56.39,13.17)
  Inner2 w0.2: v1(56.39,13.17) 53.71,13.17 v1(49.65,17.24)
IDA1: length 42.6
  Top Layer w0.2: U2.26 51.91,8.4 v1(51.6,8.09)
  Inner2 w0.2: J2.3 13.91,9.38 50.31,9.38 v1(51.6,8.09)
LGATE1: length 19.9
  Top Layer w0.2: v1(56.89,12.54) 56.61,12.26 U2.16
  Top Layer w0.254: v1(48.63,24.26) Q1.6
  Inner2 w0.2: v1(48.63,24.26) 48.63,17.16 53.25,12.54 v1(56.89,12.54)
NTC1: length 8.3
  Top Layer w0.2: R2.2 50.66,13.66 50.66,9.62 51.08,9.2 U2.24
PSET1: length 3.5
  Top Layer w0.2: U2.21 54.61,14.3 R4.2
SW: length 9.3
  Top Layer w0.254: L3.1 14.23,44.3 9.03,44.3 R8.2 7.42,42.57 C20.2
SW1: length 27
  Top Layer w0.2: R20.2 v1(54.76,23.87)
  Top Layer w0.254: U2.18 55.81,15.01 56.89,16.09 C8.2 v1(56.89,16.85) ; 52.75,21.86 v1(54.76,23.87)
  Top Layer w2: Q1.7 47.67,21.86 46.6,20.79 46.6,17.58 L1.1
  Bottom Layer w0.254: v1(54.76,23.87) 55.97,23.87 56.89,22.95 v1(56.89,16.85)
VDRV: length 5.4
  Top Layer w0.254: R5.2 8.82,39.54 8.82,38.11 ; 8.82,38.11 9.53,38.83 U1.10 ; 8.82,38.11 C21.2

## Copper pours and planes (outline as drawn; the poured copper is in the pictures)
GND on Top Layer: -1.22,88 132.78,88 132.78,-4 -1.22,-4
GND on Bottom Layer: -1.22,88 132.78,88 132.78,-4 -1.22,-4
GND on Inner1: 1.03,83.74 130.52,83.74 130.52,0.26 1.03,0.26
GND on Inner2: -3.05,88 130.95,88 130.95,-4 -3.05,-4
VBUSA1 on Top Layer: 11.69,17.44 18.75,17.44 18.75,14.23 11.69,14.23
VBUSC1 on Top Layer: 9.32,28.08 18.96,28.08 18.96,18.25 9.32,18.25
VIN2 on Top Layer: 12.86,37.17 16.13,37.17 16.13,32.6 12.86,32.6
CSN on Top Layer: 9.77,62.69 13.49,62.69 13.49,60.92 9.77,60.92
CSNA1 on Top Layer: 19.57,17.34 21.87,17.34 21.87,13.68 19.57,13.68
CSNC1 on Top Layer: 19.56,21.37 21.86,21.37 21.86,17.69 19.56,17.69
CSPA1 on Top Layer: 23.63,20.82 39.13,20.82 39.13,14.22 23.63,14.22
SW on Top Layer: 13.07,45.81 15.54,45.81 15.54,41.28 13.07,41.28

Small or netless copper shapes (teardrops, artwork), in the pictures only: 149 on Top Layer, 35 on Bottom Layer, 92 on Inner1, 18 on Inner2

## Text on the board
Bottom Silkscreen Layer: 140W+65W / 三路多协议快充电源
Top Silkscreen Layer: 220V IN | CP-02x | Charging Station | 165W | DC OUT
